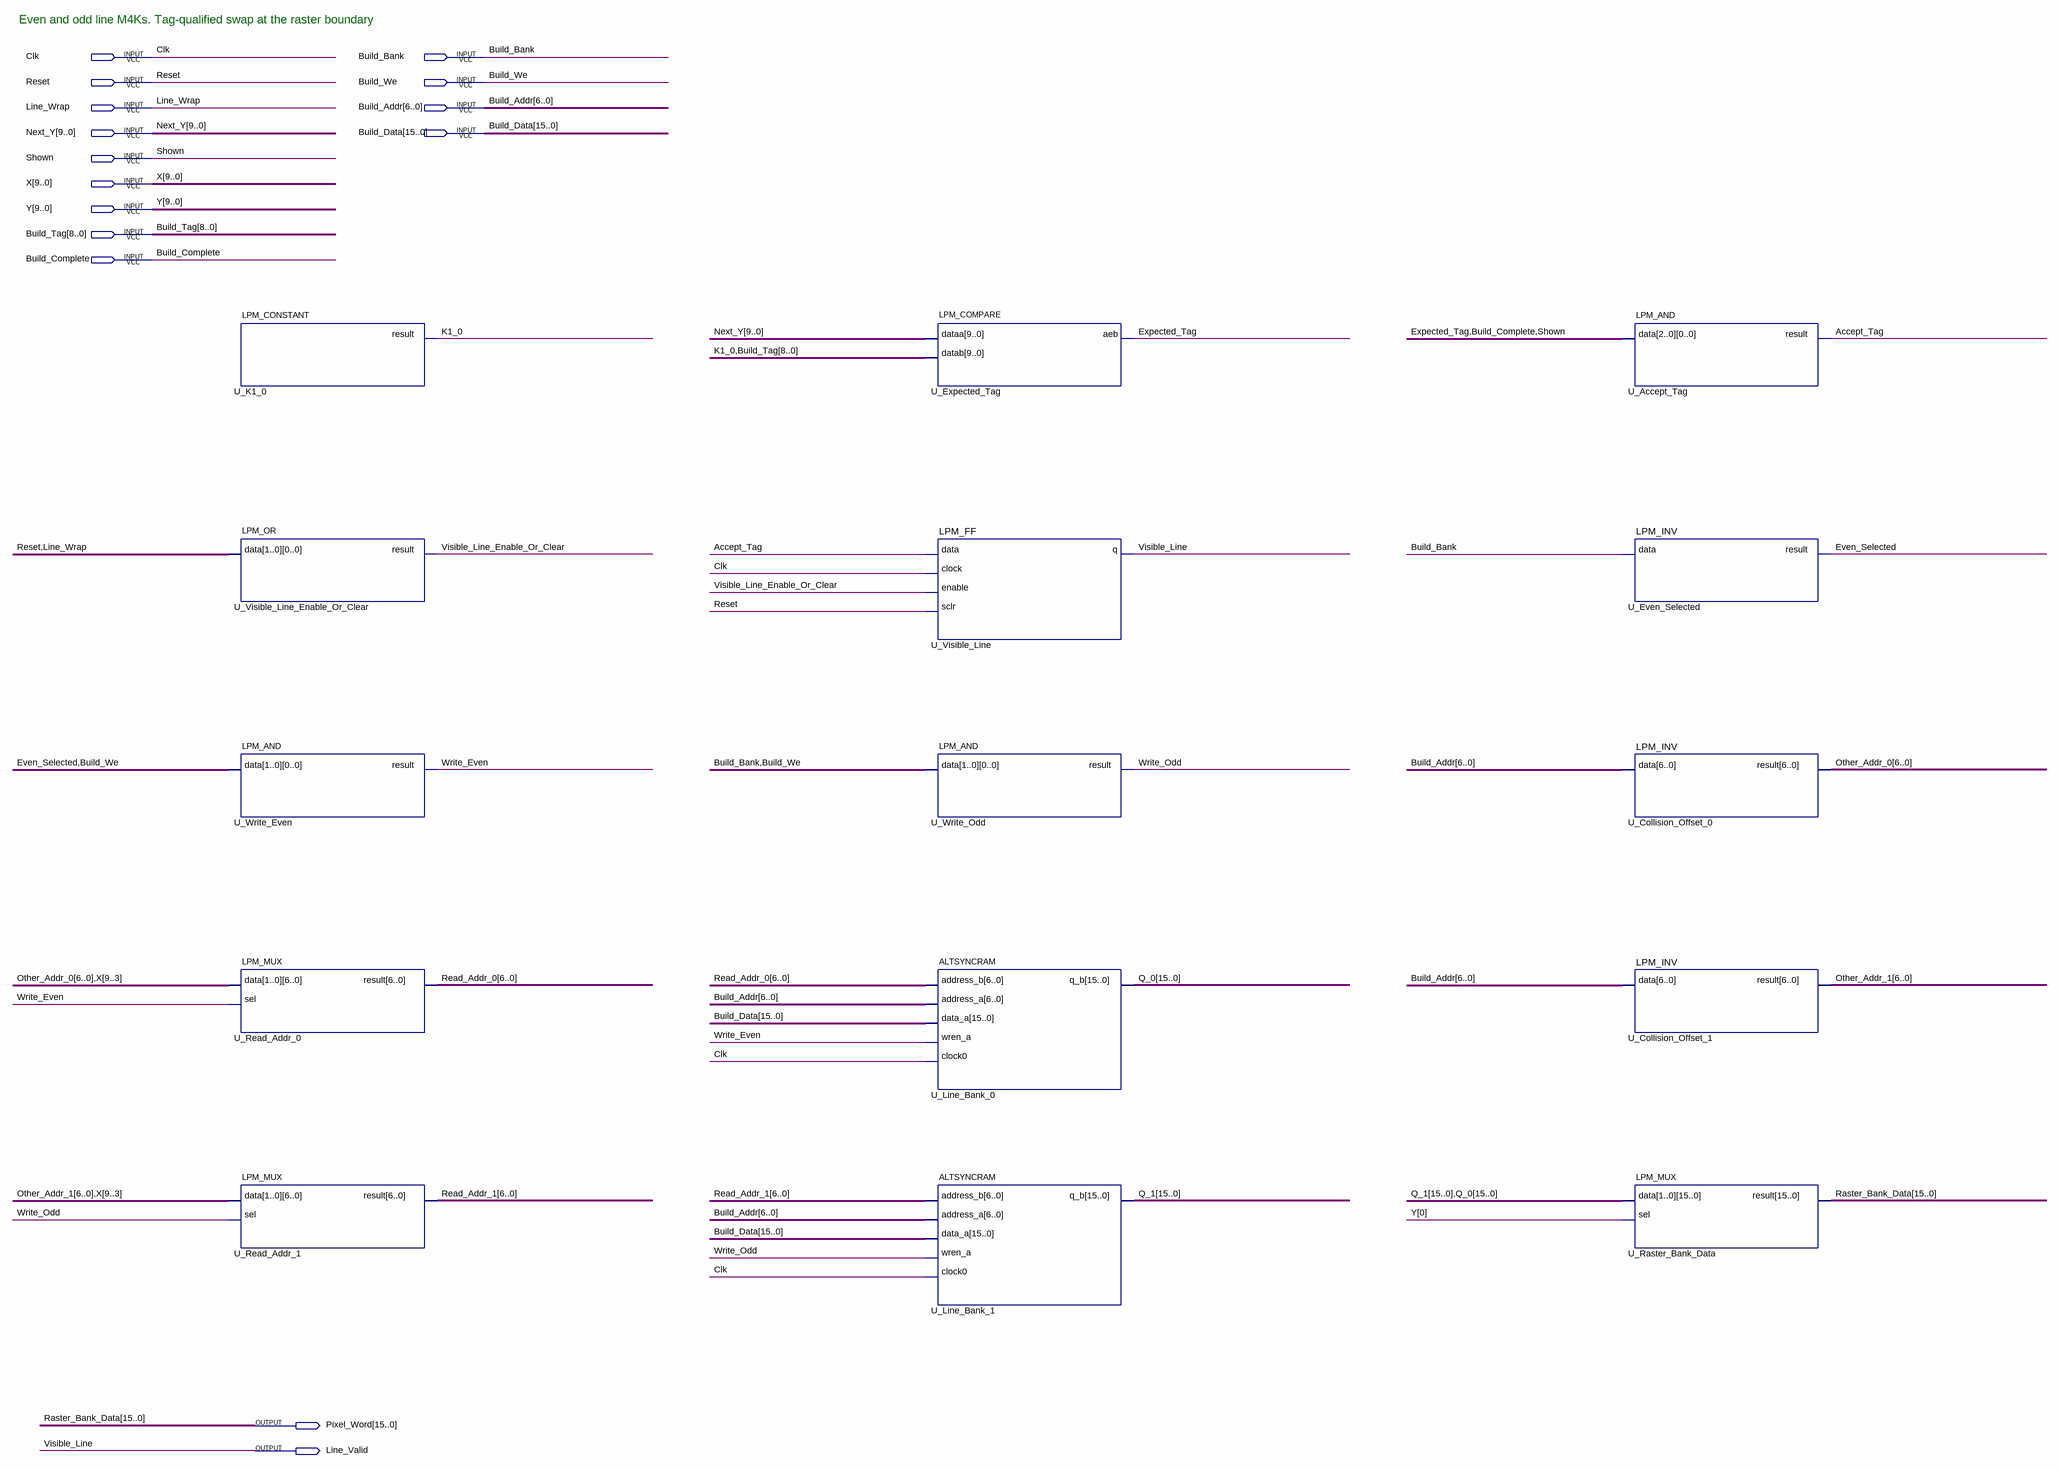
[diagram p0: schematic sheet]
// Quartus schematic Scanline_Cache.bdf as structural Verilog: 15 symbols, 15 pins
module Scanline_Cache (
  input  Clk,
  input  Build_Bank,
  input  Reset,
  input  Build_We,
  input  Line_Wrap,
  input  [6:0] Build_Addr,
  input  [9:0] Next_Y,
  input  [15:0] Build_Data,
  input  Shown,
  input  [9:0] X,
  input  [9:0] Y,
  input  [8:0] Build_Tag,
  input  Build_Complete,
  output [15:0] Pixel_Word,
  output Line_Valid
);

  wire Accept_Tag, Even_Selected, Expected_Tag, K1_0, Visible_Line_Enable_Or_Clear, Write_Even, Write_Odd;
  wire [6:0] Other_Addr_0, Other_Addr_1, Read_Addr_0, Read_Addr_1;
  wire [15:0] Q_0, Q_1;

  LPM_CONSTANT #(.LPM_WIDTH(1), .LPM_CVALUE(0)) U_K1_0 (.result(K1_0));
  LPM_OR #(.LPM_WIDTH(1), .LPM_SIZE(2)) U_Visible_Line_Enable_Or_Clear (
    .data({Reset, Line_Wrap}), .result(Visible_Line_Enable_Or_Clear));
  LPM_AND #(.LPM_WIDTH(1), .LPM_SIZE(2)) U_Write_Even (.data({Even_Selected, Build_We}), .result(Write_Even));
  LPM_MUX #(.LPM_WIDTH(7), .LPM_SIZE(2), .LPM_WIDTHS(1)) U_Read_Addr_0 (
    .data({Other_Addr_0, X[9:3]}), .sel(Write_Even), .result(Read_Addr_0));
  LPM_MUX #(.LPM_WIDTH(7), .LPM_SIZE(2), .LPM_WIDTHS(1)) U_Read_Addr_1 (
    .data({Other_Addr_1, X[9:3]}), .sel(Write_Odd), .result(Read_Addr_1));
  LPM_COMPARE #(.LPM_WIDTH(10), .LPM_REPRESENTATION("UNSIGNED")) U_Expected_Tag (
    .dataa(Next_Y), .datab({K1_0, Build_Tag}), .aeb(Expected_Tag));
  LPM_FF #(.LPM_WIDTH(1), .LPM_FFTYPE("DFF")) U_Visible_Line (
    .data(Accept_Tag), .clock(Clk), .enable(Visible_Line_Enable_Or_Clear), .sclr(Reset), .q(Line_Valid));
  LPM_AND #(.LPM_WIDTH(1), .LPM_SIZE(2)) U_Write_Odd (.data({Build_Bank, Build_We}), .result(Write_Odd));
  ALTSYNCRAM #(.OPERATION_MODE("DUAL_PORT"), .RAM_BLOCK_TYPE("M4K"), .WIDTH_A(16), .WIDTH_B(16), .WIDTHAD_A(7), .WIDTHAD_B(7), .NUMWORDS_A(128), .NUMWORDS_B(128), .ADDRESS_REG_B("CLOCK0"), .OUTDATA_REG_B("UNREGISTERED"), .READ_DURING_WRITE_MODE_MIXED_PORTS("DONT_CARE")) U_Line_Bank_0 (
    .address_b(Read_Addr_0), .address_a(Build_Addr), .data_a(Build_Data), .wren_a(Write_Even), .clock0(Clk),
    .q_b(Q_0));
  ALTSYNCRAM #(.OPERATION_MODE("DUAL_PORT"), .RAM_BLOCK_TYPE("M4K"), .WIDTH_A(16), .WIDTH_B(16), .WIDTHAD_A(7), .WIDTHAD_B(7), .NUMWORDS_A(128), .NUMWORDS_B(128), .ADDRESS_REG_B("CLOCK0"), .OUTDATA_REG_B("UNREGISTERED"), .READ_DURING_WRITE_MODE_MIXED_PORTS("DONT_CARE")) U_Line_Bank_1 (
    .address_b(Read_Addr_1), .address_a(Build_Addr), .data_a(Build_Data), .wren_a(Write_Odd), .clock0(Clk),
    .q_b(Q_1));
  LPM_AND #(.LPM_WIDTH(1), .LPM_SIZE(3)) U_Accept_Tag (
    .data({Expected_Tag, Build_Complete, Shown}), .result(Accept_Tag));
  LPM_INV #(.LPM_WIDTH(1)) U_Even_Selected (.data(Build_Bank), .result(Even_Selected));
  LPM_INV #(.LPM_WIDTH(7)) U_Collision_Offset_0 (.data(Build_Addr), .result(Other_Addr_0));
  LPM_INV #(.LPM_WIDTH(7)) U_Collision_Offset_1 (.data(Build_Addr), .result(Other_Addr_1));
  LPM_MUX #(.LPM_WIDTH(16), .LPM_SIZE(2), .LPM_WIDTHS(1)) U_Raster_Bank_Data (
    .data({Q_1, Q_0}), .sel(Y[0]), .result(Pixel_Word));

  // Other names for the same wires on the sheet: Raster_Bank_Data[15:0] = Pixel_Word; Visible_Line = Line_Valid

  // Notes on the sheet:
  //   Even and odd line M4Ks. Tag-qualified swap at the raster boundary
endmodule
